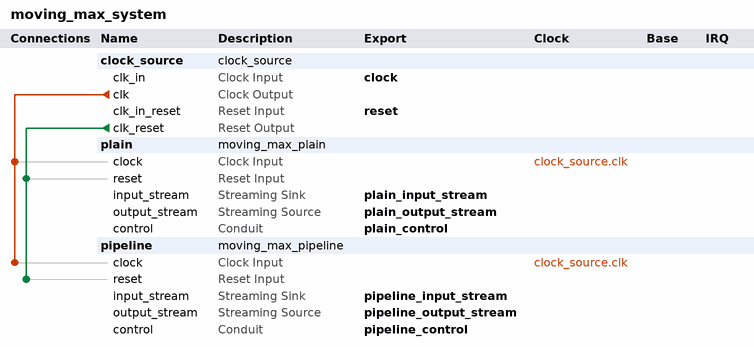
[diagram p0: system contents]
# Platform Designer (Qsys) system moving_max_system, Cyclone V 5CSEMA5F31C6
# Parameters at their usual value, and those the tool derives, are not listed.
package require -exact qsys 25.1
create_system moving_max_system
set_project_property DEVICE_FAMILY {Cyclone V}
set_project_property DEVICE 5CSEMA5F31C6

add_instance clock_source clock_source 25.1
set_instance_parameter_value clock_source clockFrequency 100000000

add_instance plain moving_max_plain 1.0
set_instance_parameter_value plain PIPELINED false

add_instance pipeline moving_max_pipeline 1.0
set_instance_parameter_value pipeline PIPELINED true

# connections
add_connection clock_source.clk pipeline.clock clock
add_connection clock_source.clk plain.clock clock
add_connection clock_source.clk_reset pipeline.reset reset
add_connection clock_source.clk_reset plain.reset reset

# exported interfaces
add_interface clock clock sink
set_interface_property clock EXPORT_OF clock_source.clk_in
add_interface pipeline_control conduit end
set_interface_property pipeline_control EXPORT_OF pipeline.control
add_interface pipeline_input_stream avalon_streaming sink
set_interface_property pipeline_input_stream EXPORT_OF pipeline.input_stream
add_interface pipeline_output_stream avalon_streaming source
set_interface_property pipeline_output_stream EXPORT_OF pipeline.output_stream
add_interface plain_control conduit end
set_interface_property plain_control EXPORT_OF plain.control
add_interface plain_input_stream avalon_streaming sink
set_interface_property plain_input_stream EXPORT_OF plain.input_stream
add_interface plain_output_stream avalon_streaming source
set_interface_property plain_output_stream EXPORT_OF plain.output_stream
add_interface reset reset sink
set_interface_property reset EXPORT_OF clock_source.clk_in_reset

set_interconnect_requirement {$system} qsys_mm.clockCrossingAdapter HANDSHAKE
set_interconnect_requirement {$system} qsys_mm.enableEccProtection FALSE
set_interconnect_requirement {$system} qsys_mm.insertDefaultSlave FALSE
set_interconnect_requirement {$system} qsys_mm.maxAdditionalLatency 1

save_system moving_max_system.qsys
